# EAGLE design Motor Connection V1 (EAGLE 9.5.1)
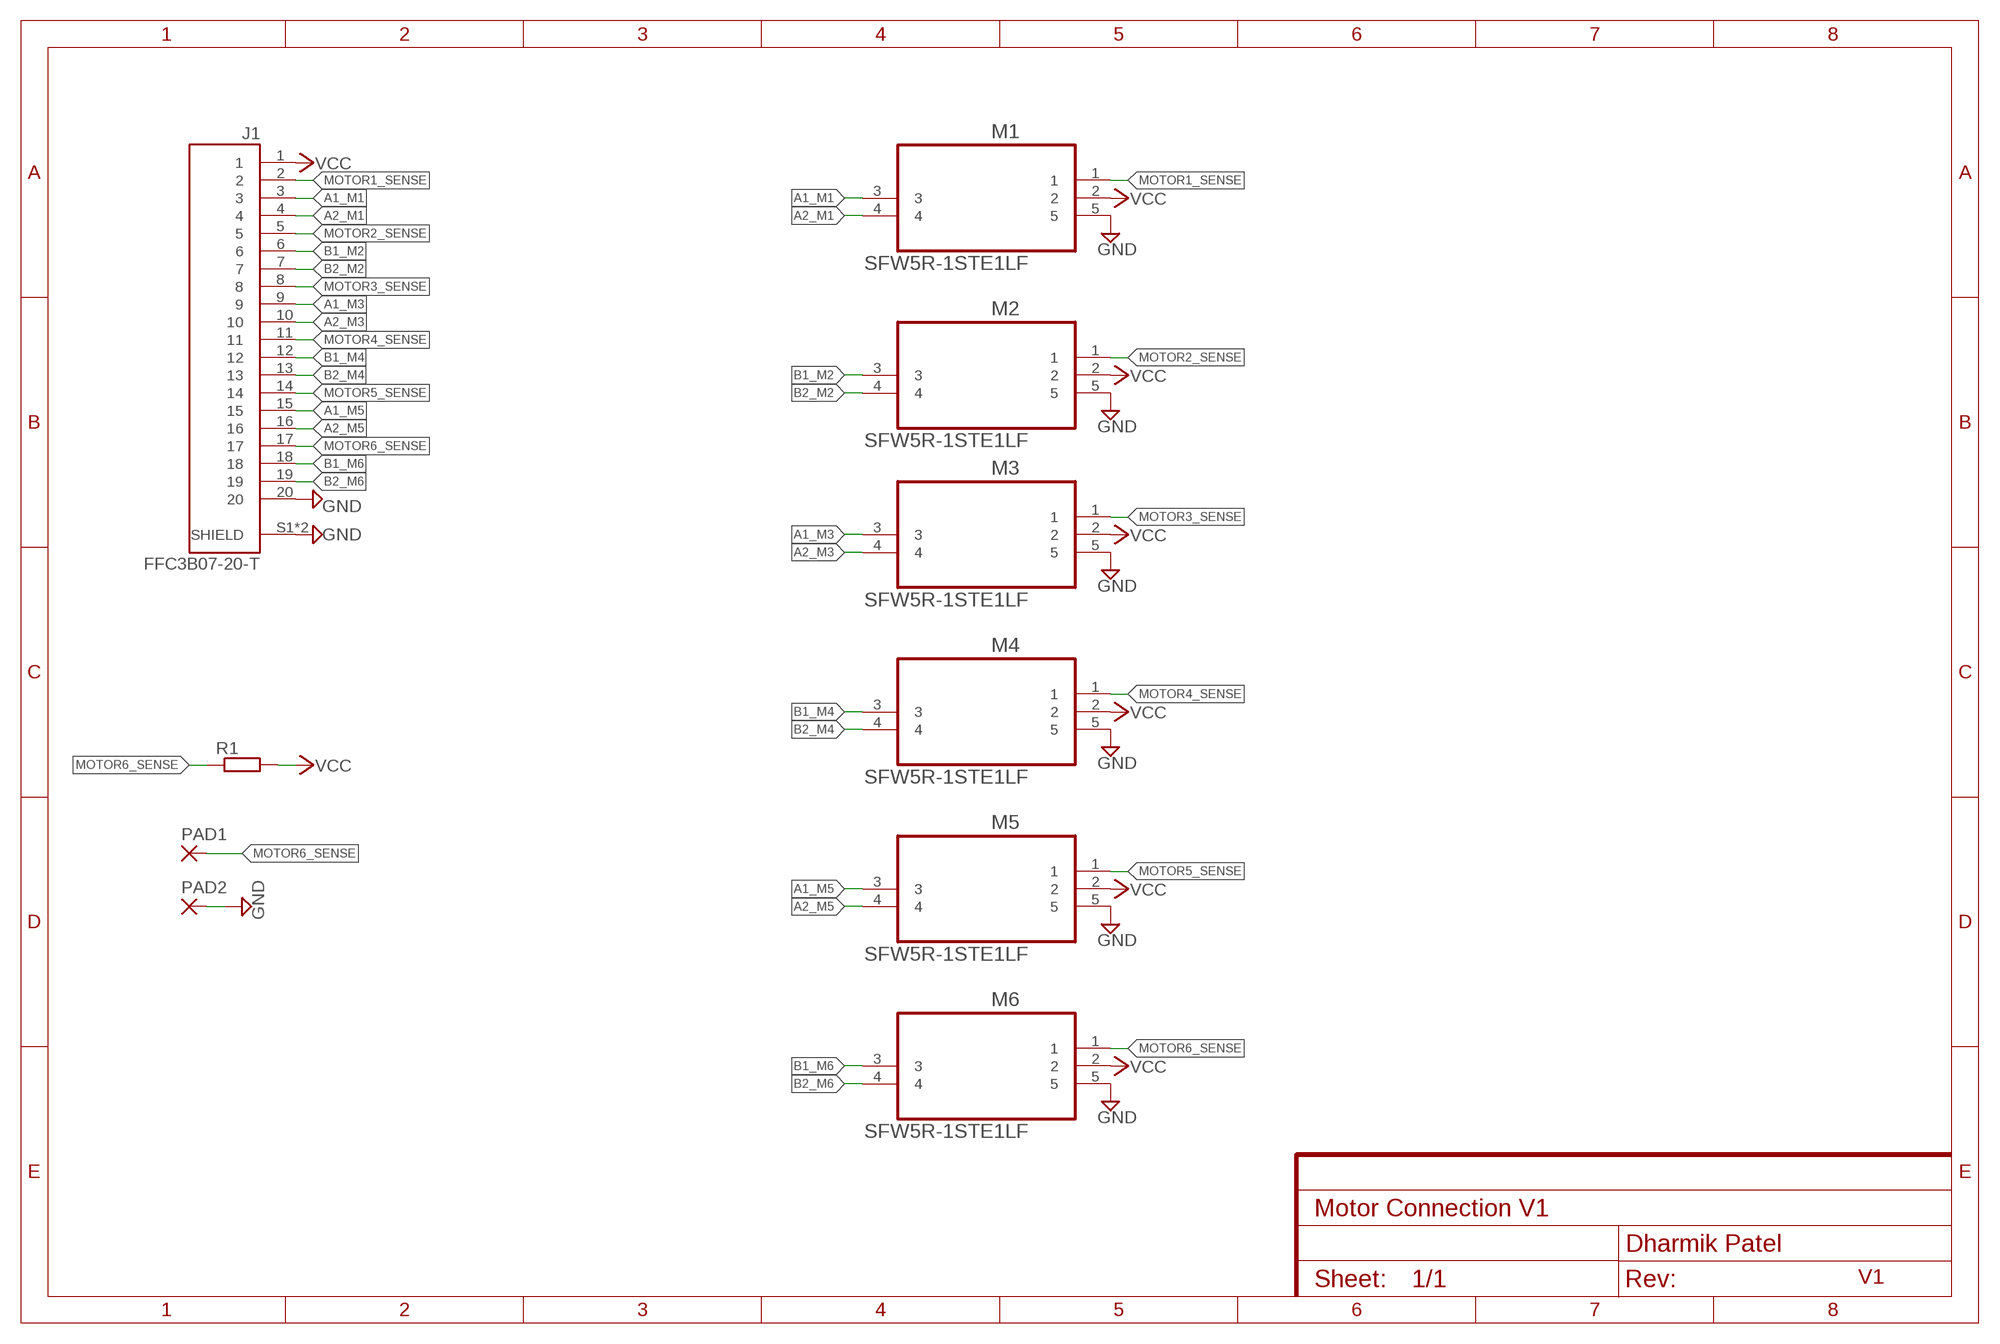
[diagram p0: schematic, sheet 1]
FRAME1 (FRAME-A4L): DESIGNER: Dharmik Patel; REV: V1

## Parts
J1  FFC3B07-20-T  [GCT_FFC3B07-20-T]
M1  SFW5R-1STE1LF  [FCI_SFW5R-1STE1LF]
M2  SFW5R-1STE1LF  [FCI_SFW5R-1STE1LF]
M3  SFW5R-1STE1LF  [FCI_SFW5R-1STE1LF]
M4  SFW5R-1STE1LF  [FCI_SFW5R-1STE1LF]
M5  SFW5R-1STE1LF  [FCI_SFW5R-1STE1LF]
M6  SFW5R-1STE1LF  [FCI_SFW5R-1STE1LF]
PAD1  SMD2  [SMD1,27-2,54]
PAD2  SMD2  [SMD1,27-2,54]
R1  R-EU_R0603  [R0603]

## Nets
A1_M1: J1.3 M1.3
A1_M3: J1.9 M3.3
A1_M5: J1.15 M5.3
A2_M1: J1.4 M1.4
A2_M3: J1.10 M3.4
A2_M5: J1.16 M5.4
B1_M2: J1.6 M2.3
B1_M4: J1.12 M4.3
B1_M6: J1.18 M6.3
B2_M2: J1.7 M2.4
B2_M4: J1.13 M4.4
B2_M6: J1.19 M6.4
GND: J1.20 J1.S1(SHIELD) J1.S2(SHIELD) M1.5 M2.5 M3.5 M4.5 M5.5 M6.5 PAD2.1(P)
MOTOR1_SENSE: J1.2 M1.1
MOTOR2_SENSE: J1.5 M2.1
MOTOR3_SENSE: J1.8 M3.1
MOTOR4_SENSE: J1.11 M4.1
MOTOR5_SENSE: J1.14 M5.1
MOTOR6_SENSE: J1.17 M6.1 PAD1.1(P) R1.1
VCC: J1.1 M1.2 M2.2 M3.2 M4.2 M5.2 M6.2 R1.2

## Library data of the parts
J1 = FFC3B07-20-T:FFC3B07-20-T: FPC 1.0mm Pitch, Side entry, Top contact, SMT, Height 2.5mm, Slide type Check availability <https://pricing.snapeda.com/parts/FFC3B07-20-T/Global%20Connector%20Technology/view-part?ref=eda>; AVAILABILITY: In Stock; DESCRIPTION: 20 Position FFC, FPC Connector Contacts, Bottom 0.039 (1.00mm) Surface Mount, Right Angle; MF: Global Connector Technology; MP: FFC3B07-20-T; PACKAGE: None; PRICE: None; PURCHASE-URL: https://pricing.snapeda.com/search/part/FFC3B07-20-T/?ref=eda
M1-M6 = Firgelli SFW5R-1STE1LF:SFW5R-1STE1LF: FFC/FPC CONNECTOR, RECEPTACLE, 5POS 1ROW; MPN: SFW5R-1STE1LF; OC_FARNELL: 1835598; OC_NEWARK: 62K5638; PACKAGE: CONNECTOR-5POS; SUPPLIER: FCI
PAD1 PAD2 = dharmik-wirepad:SMD2: SMD PAD
R1 = Capasitor_dharmiks:R-EU_: RESISTOR, European symbol

## Board
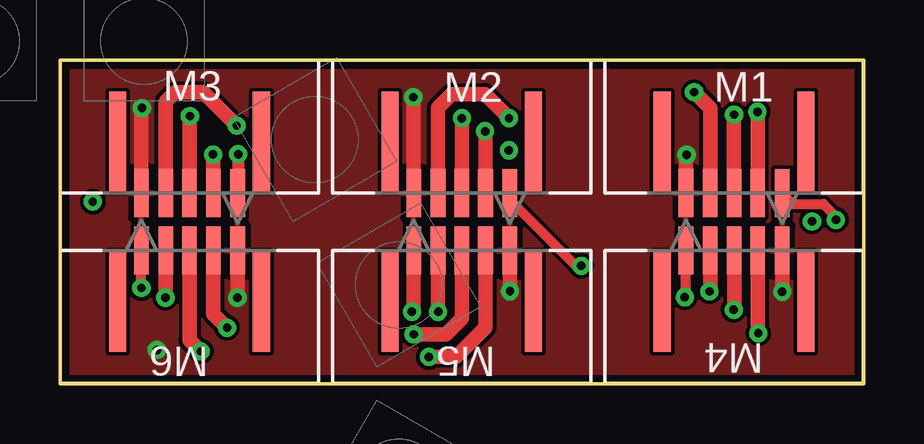
[diagram p1: board, top side]
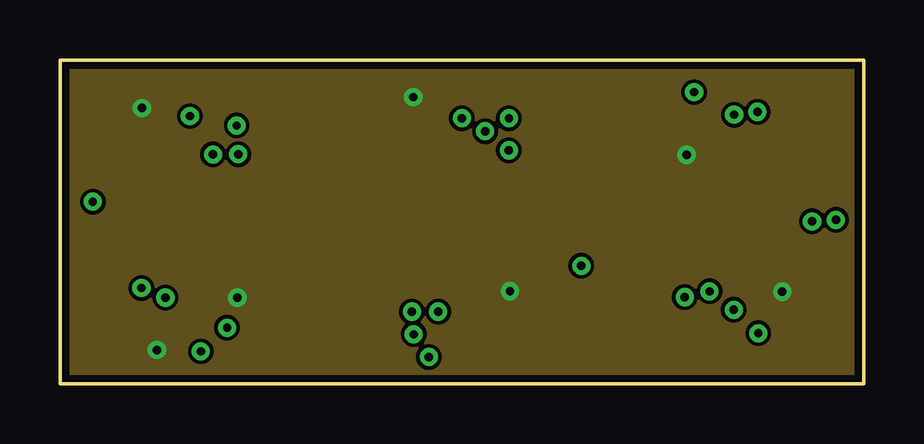
[diagram p2: board, inner layer Route2]
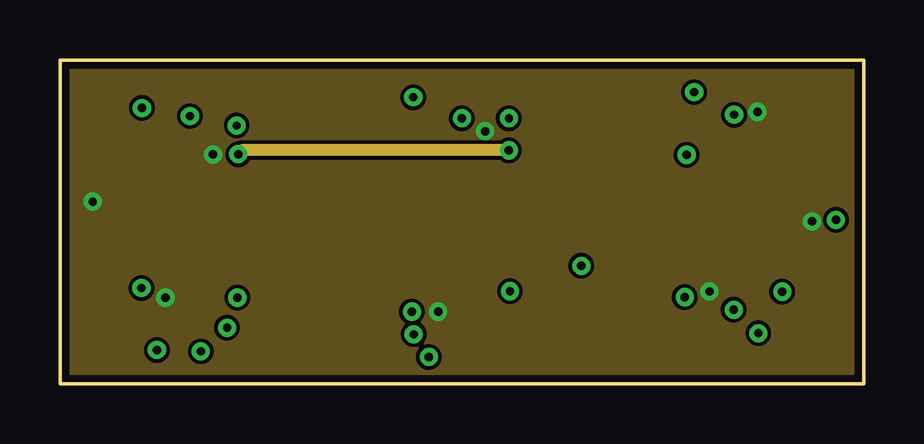
[diagram p3: board, inner layer Route15]
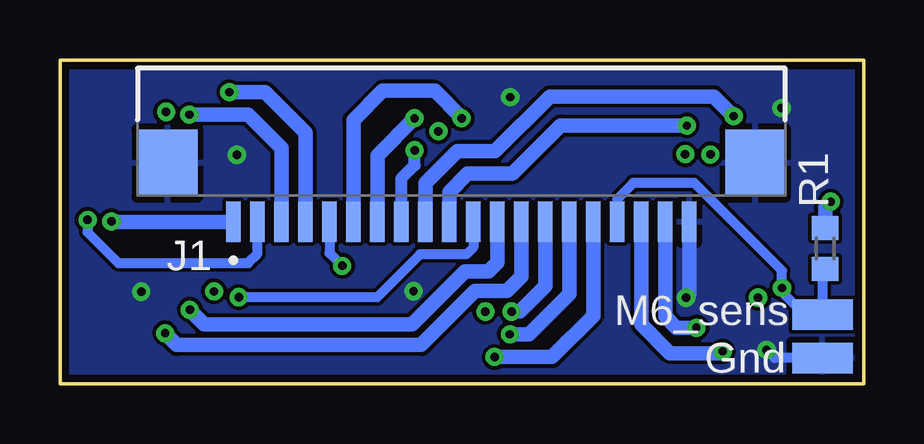
[diagram p4: board, bottom side, seen from below]

Size 33.5 x 13.5 mm. Coordinates in mm from the lower left corner, seen from the top.
Outline: 0,0 33.5,0 33.5,13.5 0,13.5 0,0
Copper layers (1*2*15*16): Top 0.035mm / dielectric 0.2mm / Route2 0.035mm / dielectric 1mm / Route15 0.035mm / dielectric 0.2mm / Bottom 0.035mm
Design rules "default *": minimum track width 6mil, minimum drill 0.35mm, track to track 6mil, track to pad 6mil, pad to pad 6mil, via to via 6mil, smd to smd 6mil, copper to edge 0.3mm, drill to drill 6mil, minimum pad ring 10mil, minimum via ring 8mil, stop-mask expansion 4mil, vias tented up to drill 10mm, thermal gap 10mil

### Footprints (pad centres in the part's own frame; a part is rotated, then mirrored left to right if it is on the bottom)
GCT_FFC3B07-20-T = smd 0.6 x 1.7: 1 9.5,2.45; 2 8.5,2.45; 3 7.5,2.45; 4 6.5,2.45; 5 5.5,2.45; 6 4.5,2.45; 7 3.5,2.45; 8 2.5,2.45; 9 1.5,2.45; 10 0.5,2.45; 11 -0.5,2.45; 12 -1.5,2.45; 13 -2.5,2.45; 14 -3.5,2.45; 15 -4.5,2.45; 16 -5.5,2.45; 17 -6.5,2.45; 18 -7.5,2.45; 19 -8.5,2.45; 20 -9.5,2.45 | smd 2.5 x 2.8: S1 12.25,0; S2 -12.25,0
FCI_SFW5R-1STE1LF = smd 0.61 x 2.007: 1 2.007,2.743; 2 0.991,2.743; 3 0,2.743; 4 -0.991,2.743; 5 -2.007,2.743 | smd 0.711 x 4.191: 6 -2.997,4.877; 7 2.997,4.877
SMD1,27-2,54 = smd 1.27 x 2.54: 1 0,0
R0603 = smd 1 x 1.1: 1 -0.85,0; 2 0.85,0

### Placement (x,y rotation side)
J1  16.77,9.2 180 bottom
M1  28.1,5.2 0 top
M2  16.75,5.2 0 top
M3  5.4,5.2 0 top
M4  28.1,8.3 180 top
M5  16.75,8.3 180 top
M6  5.4,8.3 180 top
PAD1  1.71,2.88 270 bottom
PAD2  1.71,1.06 270 bottom
R1  1.6,5.63 90 bottom

### Tracks (layer width: path | path; a pad name or v marks a point on that pad's centre or on a via)
A1_M1  (via drill 0.35)
  Top 0.61: v28.1,11.22 M1.3
  Bottom 0.61: J1.3 24.27,9.83 25.66,11.22 v28.1,11.22
A1_M3  (via drill 0.35)
  Top 0.61: M3.3 5.4,11.14 v5.42,11.16
  Bottom 0.61: v5.42,11.16 6.23,11.97 13.08,11.97 15.36,9.7 16.93,9.7 18.27,8.36 J1.9
A1_M5  (via drill 0.35)
  Top 0.61: v14.74,2.05 16.09,2.05 16.75,2.71 M5.3
  Bottom 0.61: J1.15 12.27,3.73 13.95,2.05 v14.74,2.05
A2_M1  (via drill 0.35)
  Top 0.61: M1.4 27.11,11.49 v26.44,12.16
  Bottom 0.61: v26.44,12.16 24.95,12.16 23.27,10.48 J1.4
A2_M3  (via drill 0.35)
  Top 0.61: M3.4 4.41,11.76 4.8,12.15 5.97,12.15 v7.36,10.76
  Bottom 0.61: J1.10 17.27,8 16.51,8.76 14.63,8.76 12.63,10.76 v7.36,10.76
A2_M5  (via drill 0.35)
  Top 0.61: M5.4 17.74,2.35 16.51,1.11 v15.38,1.11
  Bottom 0.61: v15.38,1.11 12.98,1.11 11.27,2.82 J1.16
B1_M2  (via drill 0.35)
  Top 0.61: M2.3 v16.75,11.06 v16.76,11.07
  Bottom 0.61: v16.76,11.07 16.76,11.1 17.87,12.21 20.05,12.21 21.27,11 J1.6
B1_M4  (via drill 0.35)
  Top 0.61: v28.09,3.08 28.11,3.1 M4.3
  Bottom 0.61: J1.12 15.27,5.06 15.64,4.68 16.61,4.68 18.82,2.47 27.48,2.47 v28.09,3.08
B1_M6  (via drill 0.35)
  Top 0.61: M6.3 5.4,1.81 v5.87,1.34
  Bottom 0.61: v5.87,1.34 5.94,1.27 8.07,1.27 9.27,2.47 J1.18
B2_M2  (via drill 0.35)
  Top 0.61: M2.4 15.76,11.51 16.32,12.07 17.71,12.07 v18.72,11.07
  Bottom 0.61: v18.72,11.07 20.27,9.52 J1.7
B2_M4  (via drill 0.35)
  Top 0.61: v29.11,2.1 29.09,2.12 M4.4
  Bottom 0.61: J1.13 14.27,4.46 14.88,3.86 16.19,3.86 18.44,1.61 28.63,1.61 v29.11,2.1
B2_M6  (via drill 0.35)
  Top 0.61: M6.4 6.39,2.9 v6.97,2.33
  Bottom 0.61: v6.97,2.33 7.8,2.33 8.27,2.79 J1.19
GND  (via drill 0.35)
  Top 0.61: M6.5 7.41,3.59 v7.4,3.58 | M5.5 v18.76,3.86 v18.76,3.85 | M4.5 v30.11,3.83 | M2.5 14.74,11.93 v14.73,11.95 | M1.5 26.09,9.51 v26.12,9.54 | M3.5 3.39,11.49 v3.41,11.49
  Bottom 0.406: PAD2.1 3.7,1.06 v4.04,1.4
  Bottom 0.61: J1.20 7.27,3.71 v7.4,3.58
  pour Route2: -3,16 36,16 36,-3 -3,-3
  pour Top: -4,17 37,17 37,-4 -4,-4
  pour Bottom: -1,14 34,14 34,-1 -1,-1
MOTOR1_SENSE  (via drill 0.35)
  Top 0.406: M1.1 30.55,7.5 31.83,7.5 32.35,6.98 v32.35,6.83
  Bottom 0.406: v32.35,6.83 32.35,6.31 31.06,5.03 25.65,5.03 25.27,5.41 J1.2
MOTOR2_SENSE  (via drill 0.35)
  Top 0.406: v21.73,4.91 21.51,4.91 18.76,7.66 M2.1
  Bottom 0.406: J1.5 22.27,5.45 v21.73,4.91
MOTOR3_SENSE  (via drill 0.35)
  Top 0.508: v7.43,9.57 7.43,7.97 M3.1
  Route15 0.508: v18.71,9.73 7.59,9.73 v7.43,9.57
  Bottom 0.508: J1.8 19.28,8.54 18.71,9.11 v18.71,9.73
MOTOR4_SENSE  (via drill 0.35)
  Top 0.406: v26.05,3.6 26.1,3.66 26.1,5.55 M4.1
  Bottom 0.406: J1.11 16.27,5.68 16.56,5.39 18.49,5.39 20.28,3.6 v26.05,3.6
MOTOR5_SENSE  (via drill 0.35)
  Top 0.61: M5.1 14.74,3.07 v14.67,3
  Bottom 0.61: v14.67,3 14.33,3 13.27,4.06 J1.14
MOTOR6_SENSE  (via drill 0.35)
  Top 0.406: v3.4,3.99 v3.39,3.99 M6.1
  Bottom 0.406: R1.1 1.71,4.68 PAD1.1 2.46,2.88 3.41,3.83 3.41,3.97 v3.4,3.99 3.4,4.71 7.06,8.37 9.6,8.37 10.27,7.7 J1.17
VCC  (via drill 0.35)
  Top 0.61: M6.2 4.41,3.6 v4.4,3.58 | M5.2 v15.76,3 | M4.2 27.11,3.88 v27.08,3.85 | M2.2 17.74,10.51 v17.72,10.53 | M1.2 29.09,11.32 v29.08,11.33 | M3.2 v6.39,9.55 v6.38,9.56
  Bottom 0.61: J1.1 31.33,6.75 v31.35,6.77 | R1.2 1.6,7.35 v1.37,7.59
  pour Route15: -2,15 -2,-2 35,-2 35,15

### Text on the board
bPlace: M6_sens | Gnd